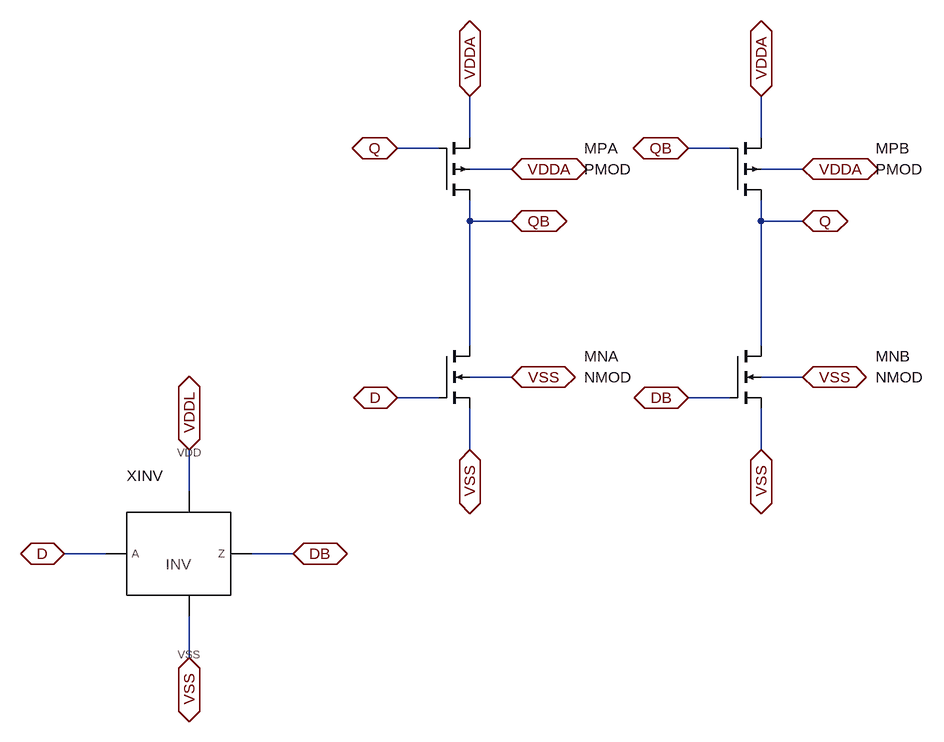
[diagram p0: schematic DAC_LevelShift.asc]
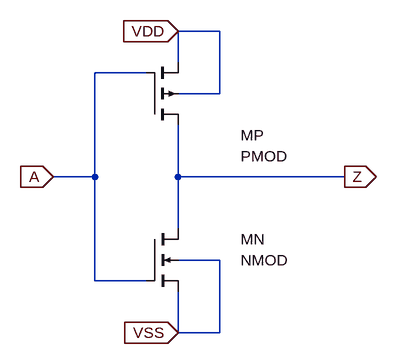
[diagram p1: sub-circuit cmos_inv.asc]
DAC_LevelShift.asc, the LTspice schematic file:
Version 4.1
SHEET 1 1632 1136
WIRE 192 832 128 832
WIRE 416 832 480 832
WIRE 320 736 320 672
WIRE 320 928 320 992
WIRE 752 192 752 128
WIRE 752 240 816 240
WIRE 704 208 640 208
WIRE 752 288 752 336
WIRE 752 320 816 320
WIRE 752 336 752 512
WIRE 704 592 640 592
WIRE 752 560 816 560
WIRE 752 608 752 672
WIRE 1200 192 1200 128
WIRE 1200 240 1264 240
WIRE 1152 208 1088 208
WIRE 1200 288 1200 336
WIRE 1200 320 1264 320
WIRE 1200 336 1200 512
WIRE 1152 592 1088 592
WIRE 1200 560 1264 560
WIRE 1200 608 1200 672
FLAG 128 832 D
IOPIN 128 832 BiDir
FLAG 480 832 DB
IOPIN 480 832 BiDir
FLAG 320 672 VDDL
IOPIN 320 672 BiDir
FLAG 320 992 VSS
IOPIN 320 992 BiDir
FLAG 752 128 VDDA
IOPIN 752 128 BiDir
FLAG 816 240 VDDA
IOPIN 816 240 BiDir
FLAG 640 208 Q
IOPIN 640 208 BiDir
FLAG 816 320 QB
IOPIN 816 320 BiDir
FLAG 640 592 D
IOPIN 640 592 BiDir
FLAG 816 560 VSS
IOPIN 816 560 BiDir
FLAG 752 672 VSS
IOPIN 752 672 BiDir
FLAG 1200 128 VDDA
IOPIN 1200 128 BiDir
FLAG 1264 240 VDDA
IOPIN 1264 240 BiDir
FLAG 1088 208 QB
IOPIN 1088 208 BiDir
FLAG 1264 320 Q
IOPIN 1264 320 BiDir
FLAG 1088 592 DB
IOPIN 1088 592 BiDir
FLAG 1264 560 VSS
IOPIN 1264 560 BiDir
FLAG 1200 672 VSS
IOPIN 1200 672 BiDir
SYMBOL CMOS_INV 192 736 R0
WINDOW 0 32 -24 Left 2
SYMATTR InstName XINV
SYMBOL pmos4 704 288 M180
WINDOW 0 224 80 Left 2
WINDOW 3 224 48 Left 2
SYMATTR InstName MPA
SYMATTR Value PMOD
SYMATTR SpiceLine W=4u L=1u
SYMBOL nmos4 704 512 R0
WINDOW 0 224 16 Left 2
WINDOW 3 224 48 Left 2
SYMATTR InstName MNA
SYMATTR Value NMOD
SYMATTR SpiceLine W=40u L=1u
SYMBOL pmos4 1152 288 M180
WINDOW 0 224 80 Left 2
WINDOW 3 224 48 Left 2
SYMATTR InstName MPB
SYMATTR Value PMOD
SYMATTR SpiceLine W=4u L=1u
SYMBOL nmos4 1152 512 R0
WINDOW 0 224 16 Left 2
WINDOW 3 224 48 Left 2
SYMATTR InstName MNB
SYMATTR Value NMOD
SYMATTR SpiceLine W=40u L=1u

cmos_inv.asc, the sub-circuit schematic file:
Version 4.1
SHEET 1 800 640
WIRE 352 192 352 272
WIRE 352 272 352 352
WIRE 352 272 608 272
WIRE 304 112 224 112
WIRE 224 112 224 272
WIRE 224 272 224 432
WIRE 224 432 304 432
WIRE 224 272 160 272
WIRE 352 96 352 48
WIRE 352 144 416 144
WIRE 416 144 416 48
WIRE 416 48 352 48
WIRE 352 448 352 512
WIRE 352 400 416 400
WIRE 416 400 416 512
WIRE 416 512 352 512
FLAG 608 272 Z
IOPIN 608 272 Out
FLAG 160 272 A
IOPIN 160 272 In
FLAG 352 48 VDD
IOPIN 352 48 In
FLAG 352 512 VSS
IOPIN 352 512 In
SYMBOL pmos4 304 192 M180
WINDOW 0 144 -16 Left 2
WINDOW 3 144 -48 Left 2
SYMATTR InstName MP
SYMATTR Value PMOD
SYMATTR SpiceLine W=20u L=1u
SYMBOL nmos4 304 352 R0
WINDOW 0 144 16 Left 2
WINDOW 3 144 48 Left 2
SYMATTR InstName MN
SYMATTR Value NMOD
SYMATTR SpiceLine W=10u L=1u

The netlist it stands for:
* DAC_LevelShift.asc
X§XINV D DB VDDL VSS cmos_inv
MPA QB Q VDDA VDDA PMOD W=4u L=1u
MNA QB D VSS VSS NMOD W=40u L=1u
MPB Q QB VDDA VDDA PMOD W=4u L=1u
MNB Q DB VSS VSS NMOD W=40u L=1u

* block symbol definitions
.subckt cmos_inv A Z VDD VSS
MP Z A VDD VDD PMOD W=20u L=1u
MN Z A VSS VSS NMOD W=10u L=1u
.ends cmos_inv

.model NMOS NMOS
.model PMOS PMOS
.lib standard.mos
.backanno
.end